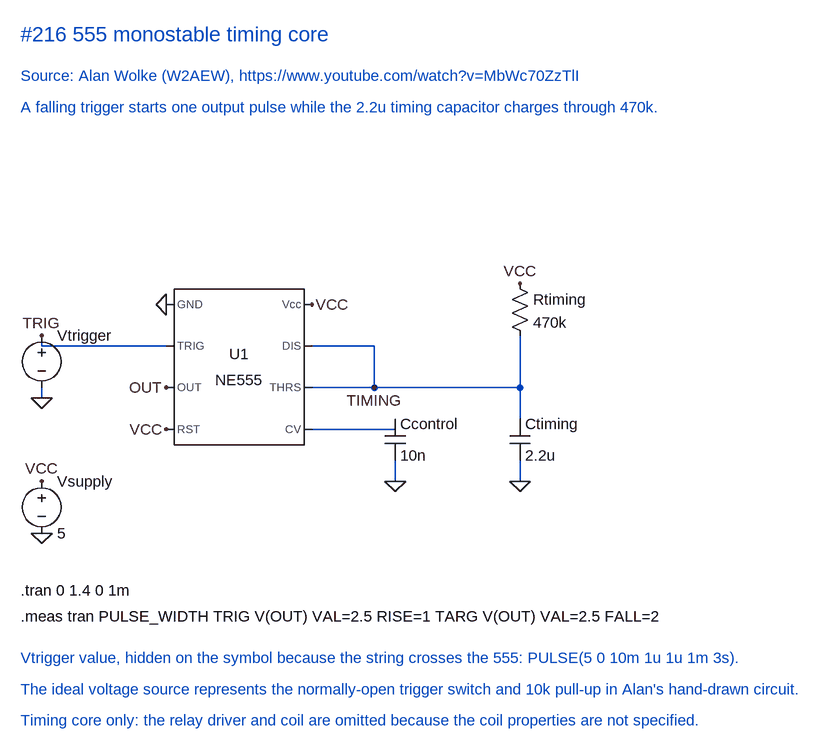
[diagram p0: schematic 555 one-shot timing core.asc]
555 one-shot timing core.asc, the LTspice schematic file:
Version 4.1
SHEET 1 1120 880
WIRE 96 288 96 272
WIRE 288 288 96 288
WIRE 96 368 96 352
WIRE 608 288 512 288
WIRE 608 352 608 288
WIRE 608 352 512 352
WIRE 832 352 608 352
WIRE 832 272 832 352
WIRE 832 400 832 352
WIRE 640 400 640 416
WIRE 640 416 512 416
WIRE 640 496 640 464
WIRE 832 496 832 464
FLAG 96 272 TRIG
FLAG 96 368 0
FLAG 288 224 0
FLAG 288 416 VCC
FLAG 288 352 OUT
FLAG 512 224 VCC
FLAG 640 496 0
FLAG 832 192 VCC
FLAG 832 496 0
FLAG 608 352 TIMING
FLAG 96 496 VCC
FLAG 96 576 0
SYMBOL voltage 96 256 R0
WINDOW 3 0 0 Invisible 2
SYMATTR InstName Vtrigger
SYMATTR Value PULSE(5 0 10m 1u 1u 1m 3s)
SYMBOL voltage 96 480 R0
SYMATTR InstName Vsupply
SYMATTR Value 5
SYMBOL Misc\NE555 400 320 R0
SYMATTR InstName U1
SYMATTR Value NE555
SYMBOL cap 624 400 R0
SYMATTR InstName Ccontrol
SYMATTR Value 10n
SYMBOL res 816 176 R0
SYMATTR InstName Rtiming
SYMATTR Value 470k
SYMBOL cap 816 400 R0
SYMATTR InstName Ctiming
SYMATTR Value 2.2u
TEXT 64 664 Left 2 !.tran 0 1.4 0 1m
TEXT 64 704 Left 2 !.meas tran PULSE_WIDTH TRIG V(OUT) VAL=2.5 RISE=1 TARG V(OUT) VAL=2.5 FALL=2
TEXT 64 768 Left 2 ;Vtrigger value, hidden on the symbol because the string crosses the 555: PULSE(5 0 10m 1u 1u 1m 3s).
TEXT 64 816 Left 2 ;The ideal voltage source represents the normally-open trigger switch and 10k pull-up in Alan's hand-drawn circuit.
TEXT 64 864 Left 2 ;Timing core only: the relay driver and coil are omitted because the coil properties are not specified.
TEXT 64 -192 Left 3 ;#216 555 monostable timing core
TEXT 64 -128 Left 2 ;Source: Alan Wolke (W2AEW), https://www.youtube.com/watch?v=MbWc70ZzTlI
TEXT 64 -80 Left 2 ;A falling trigger starts one output pulse while the 2.2u timing capacitor charges through 470k.

The netlist it stands for:
* 555 one-shot timing core.asc
Vtrigger TRIG 0 PULSE(5 0 10m 1u 1u 1m 3s)
Vsupply VCC 0 5
X§U1 0 TRIG OUT VCC N001 TIMING TIMING VCC NE555  ; pins GND TRIG OUT RST CV THRS DIS Vcc
Ccontrol N001 0 10n
Rtiming VCC TIMING 470k
Ctiming TIMING 0 2.2u
.tran 0 1.4 0 1m
.meas tran PULSE_WIDTH TRIG V(OUT) VAL=2.5 RISE=1 TARG V(OUT) VAL=2.5 FALL=2
* Vtrigger value, hidden on the symbol because the string crosses the 555: PULSE(5 0 10m 1u 1u 1m 3s).
* The ideal voltage source represents the normally-open trigger switch and 10k pull-up in Alan's hand-drawn circuit.
* Timing core only: the relay driver and coil are omitted because the coil properties are not specified.
* #216 555 monostable timing core
* Source: Alan Wolke (W2AEW), https://www.youtube.com/watch?v=MbWc70ZzTlI
* A falling trigger starts one output pulse while the 2.2u timing capacitor charges through 470k.
.lib NE555.sub
.backanno
.end